# Altium schematic sheet Diff_Pair.SchDoc
size A4; SheetNumber: 1; SheetTotal: 1
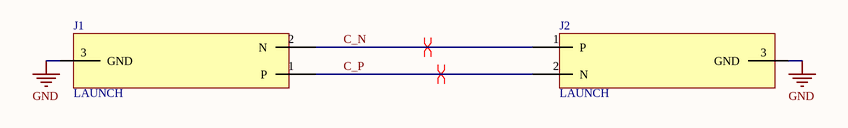
[diagram p0: Diff_Pair.SchDoc]

## Parts
J1  LAUNCH  [LAUNCH_FP]
J2  LAUNCH  [LAUNCH_FP]

## Nets
GND: J1.3(GND) J2.3(GND)
C_N: J1.2(N) J2.1(P)
C_P: J1.1(P) J2.2(N)

## Layout directives
differential pair: C_N, C_P